# Altium schematic sheet Inverter.SchDoc
size 400 x 299 mm; SheetNumber: 1; SheetTotal: 2
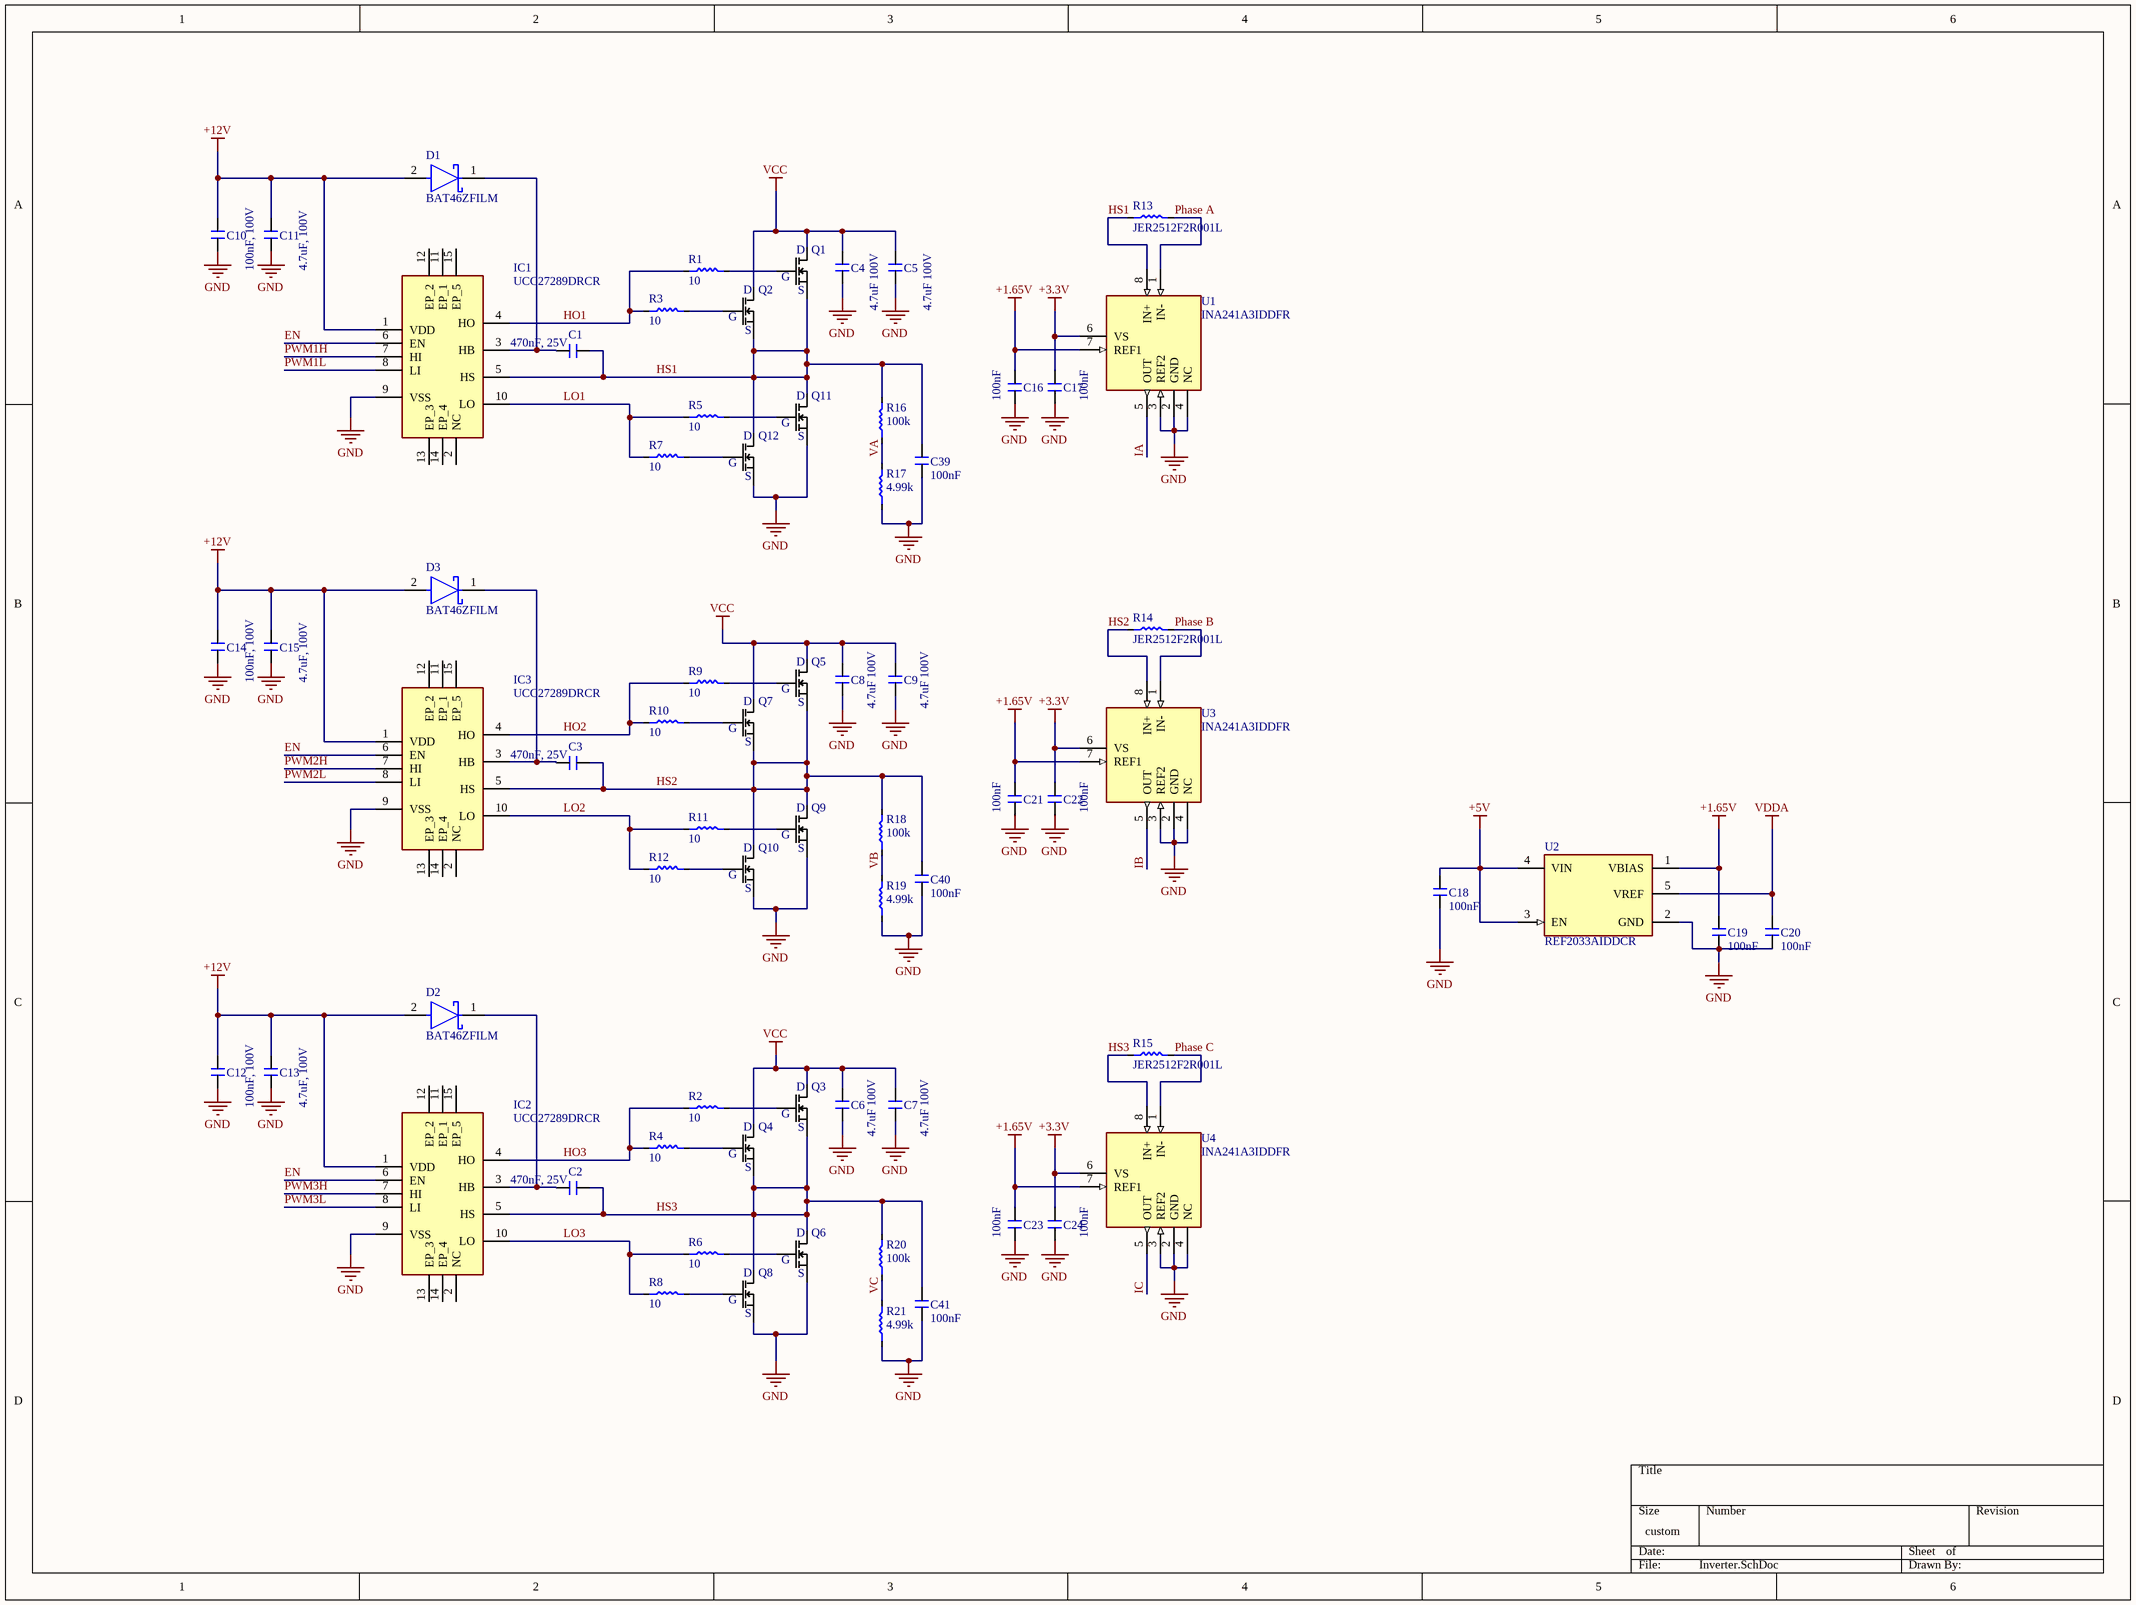
[diagram p0: Inverter.SchDoc]

## Parts
C1  470nF, 25V  [C_0805]
C2  470nF, 25V  [C_0805]
C3  470nF, 25V  [C_0805]
C4  4.7uF 100V  [C_1210]
C5  4.7uF 100V  [C_1210]
C6  4.7uF 100V  [C_1210]
C7  4.7uF 100V  [C_1210]
C8  4.7uF 100V  [C_1210]
C9  4.7uF 100V  [C_1210]
C10  100nF, 100V  [C_0805]
C11  4.7uF, 100V  [C_0805]
C12  100nF, 100V  [C_0805]
C13  4.7uF, 100V  [C_0805]
C14  100nF, 100V  [C_0805]
C15  4.7uF, 100V  [C_0805]
C16  100nF  [C_0603]
C17  100nF  [C_0603]
C18  100nF  [C_0603]
C19  100nF  [C_0603]
C20  100nF  [C_0603]
C21  100nF  [C_0603]
C22  100nF  [C_0603]
C23  100nF  [C_0603]
C24  100nF  [C_0603]
C39  100nF  [C_0603]
C40  100nF  [C_0603]
C41  100nF  [C_0603]
D1  BAT46ZFILM  [FP-SOD-123-MFG]
D2  BAT46ZFILM  [FP-SOD-123-MFG]
D3  BAT46ZFILM  [FP-SOD-123-MFG]
IC1  UCC27289DRCR  [TPS51200MDRCTEP]
IC2  UCC27289DRCR  [TPS51200MDRCTEP]
IC3  UCC27289DRCR  [TPS51200MDRCTEP]
Q1  BSZ075N08NS5ATMA1  [BSZ0909LSATMA1]  (value not drawn)
Q2  BSZ075N08NS5ATMA1  [BSZ0909LSATMA1]  (value not drawn)
Q3  BSZ075N08NS5ATMA1  [BSZ0909LSATMA1]  (value not drawn)
Q4  BSZ075N08NS5ATMA1  [BSZ0909LSATMA1]  (value not drawn)
Q5  BSZ075N08NS5ATMA1  [BSZ0909LSATMA1]  (value not drawn)
Q6  BSZ075N08NS5ATMA1  [BSZ0909LSATMA1]  (value not drawn)
Q7  BSZ075N08NS5ATMA1  [BSZ0909LSATMA1]  (value not drawn)
Q8  BSZ075N08NS5ATMA1  [BSZ0909LSATMA1]  (value not drawn)
Q9  BSZ075N08NS5ATMA1  [BSZ0909LSATMA1]  (value not drawn)
Q10  BSZ075N08NS5ATMA1  [BSZ0909LSATMA1]  (value not drawn)
Q11  BSZ075N08NS5ATMA1  [BSZ0909LSATMA1]  (value not drawn)
Q12  BSZ075N08NS5ATMA1  [BSZ0909LSATMA1]  (value not drawn)
R1  10  [R_0402]
R2  10  [R_0402]
R3  10  [R_0402]
R4  10  [R_0402]
R5  10  [R_0402]
R6  10  [R_0402]
R7  10  [R_0402]
R8  10  [R_0402]
R9  10  [R_0402]
R10  10  [R_0402]
R11  10  [R_0402]
R12  10  [R_0402]
R13  JER2512F2R001L  [JER2512F2R001L]
R14  JER2512F2R001L  [JER2512F2R001L]
R15  JER2512F2R001L  [JER2512F2R001L]
R16  100k  [R_0402]
R17  4.99k  [R_0402]
R18  100k  [R_0402]
R19  4.99k  [R_0402]
R20  100k  [R_0402]
R21  4.99k  [R_0402]
U1  INA241A3IDDFR  [SOT65P280X110-8N]
U2  REF2033AIDDCR  [FP-DDC0005A-MFG]
U3  INA241A3IDDFR  [SOT65P280X110-8N]
U4  INA241A3IDDFR  [SOT65P280X110-8N]

## Nets
+1.65V: C16.1 C19.1 C21.1 C23.1 U1.7(REF1) U2.1(VBIAS) U3.7(REF1) U4.7(REF1)
+3.3V: C17.1 C22.1 C24.1 U1.6(VS) U3.6(VS) U4.6(VS)
+5V: C18.1 U2.3(EN) U2.4(VIN)
+12V: C10.1 C11.1 C12.1 C13.1 C14.1 C15.1 D1.2(A) D2.2(A) D3.2(A) IC1.1(VDD) IC2.1(VDD) IC3.1(VDD)
GND: C4.2 C5.2 C6.2 C7.2 C8.2 C9.2 C10.2 C11.2 C12.2 C13.2 C14.2 C15.2 C16.2 C17.2 C18.2 C19.2 C20.2 C21.2 C22.2 C23.2 C24.2 C39.2 C40.2 C41.2 IC1.9(VSS) IC2.9(VSS) IC3.9(VSS) Q6.1,2,3,10(S_1) Q8.1,2,3,10(S_1) Q9.1,2,3,10(S_1) Q10.1,2,3,10(S_1) Q11.1,2,3,10(S_1) Q12.1,2,3,10(S_1) R17.2 R19.2 R21.2 U1.2(GND) U1.3(REF2) U1.4(NC) U2.2(GND) U3.2(GND) U3.3(REF2) U3.4(NC) U4.2(GND) U4.3(REF2) U4.4(NC)
VCC: C4.1 C5.1 C6.1 C7.1 C8.1 C9.1 Q1.5,6,7,8,9(D) Q2.5,6,7,8,9(D) Q3.5,6,7,8,9(D) Q4.5,6,7,8,9(D) Q5.5,6,7,8,9(D) Q7.5,6,7,8,9(D)
VDDA: C20.1 U2.5(VREF)
EN: IC1.6(EN) IC2.6(EN) IC3.6(EN)
HO1: IC1.4(HO) R1.2 R3.2
HO2: IC3.4(HO) R9.2 R10.2
HO3: IC2.4(HO) R2.2 R4.2
HS1: C1.1 C39.1 IC1.5(HS) Q1.1,2,3,10(S_1) Q2.1,2,3,10(S_1) Q11.5,6,7,8,9(D) Q12.5,6,7,8,9(D) R13.2 R16.1 U1.8(IN+)
HS2: C3.1 C40.1 IC3.5(HS) Q5.1,2,3,10(S_1) Q7.1,2,3,10(S_1) Q9.5,6,7,8,9(D) Q10.5,6,7,8,9(D) R14.2 R18.1 U3.8(IN+)
HS3: C2.1 C41.1 IC2.5(HS) Q3.1,2,3,10(S_1) Q4.1,2,3,10(S_1) Q6.5,6,7,8,9(D) Q8.5,6,7,8,9(D) R15.2 R20.1 U4.8(IN+)
IA: U1.5(OUT)
IB: U3.5(OUT)
IC: U4.5(OUT)
LO1: IC1.10(LO) R5.2 R7.2
LO2: IC3.10(LO) R11.2 R12.2
LO3: IC2.10(LO) R6.2 R8.2
Phase A: R13.1 U1.1(IN-)
Phase B: R14.1 U3.1(IN-)
Phase C: R15.1 U4.1(IN-)
PWM1H: IC1.7(HI)
PWM1L: IC1.8(LI)
PWM2H: IC3.7(HI)
PWM2L: IC3.8(LI)
PWM3H: IC2.7(HI)
PWM3L: IC2.8(LI)
VA: R16.2 R17.1
VB: R18.2 R19.1
VC: R20.2 R21.1
NetC1_2: C1.2 D1.1(C) IC1.3(HB)
NetC2_2: C2.2 D2.1(C) IC2.3(HB)
NetC3_2: C3.2 D3.1(C) IC3.3(HB)
NetQ1_4: Q1.4(G) R1.1
NetQ2_4: Q2.4(G) R3.1
NetQ3_4: Q3.4(G) R2.1
NetQ4_4: Q4.4(G) R4.1
NetQ5_4: Q5.4(G) R9.1
NetQ6_4: Q6.4(G) R6.1
NetQ7_4: Q7.4(G) R10.1
NetQ8_4: Q8.4(G) R8.1
NetQ9_4: Q9.4(G) R11.1
NetQ10_4: Q10.4(G) R12.1
NetQ11_4: Q11.4(G) R5.1
NetQ12_4: Q12.4(G) R7.1

Not connected (* = marked no-connect by the designer): IC1 2(NC) 11(EP_1) 12(EP_2) 13(EP_3) 14(EP_4) 15(EP_5); IC2 2(NC) 11(EP_1) 12(EP_2) 13(EP_3) 14(EP_4) 15(EP_5); IC3 2(NC) 11(EP_1) 12(EP_2) 13(EP_3) 14(EP_4) 15(EP_5)

## Notes on the sheet
- (in symbol BSZ075N08NS5ATMA1) S

## Library data of the parts
C1-C3 C10-C15 = C_0805: Manufacturer Part No: *; JLCPCB Part No: *
C4-C9 = C_1210
C16-C24 C39-C41 = C_0603
D1-D3 = CMP-12187-000006-1: DIODE SCHOTTKY 100V 150MA SOD123; Manufacturer: STMicroelectronics; Max Surge Forward Current: 1A; Capacitance: 10pF; Standoff Height: 0mm; Peak Reverse Current: 5uA; Value: 10pF; Max Junction Temp: +150°C; Automotive: No; Ipc Land Pattern Name: SOD375155X145-2; Device Class L2: Diodes; Device Class L1: Discrete Semiconductors; Temperature Range High: +150°C; ComponentLink2Description: Datasheet; Lead Free: Yes; Digikey Description: DIODE SCHOTTKY 100V 150MA SOD123; RoHS: TRUE; Category: Diode; Max Repetitive Reverse Voltage: 100V; ComponentLink2URL: https://www.st.com/resource/en/datasheet/bat46.pdf; Manufacturer Part Number: BAT46ZFILM; Temperature: to +150°C; Mouser Description: Schottky Diodes & Rectifiers schottky diode; Package: SOD-123; Forward Current: 150mA; Octopart: https://octopart.com/bat46zfilm-stmicroelectronics-658190; Height: 1.45mm; Device Class L3: Schottky Diodes
IC1-IC3 = UCC27289DRCR: Integrated Circuit; Manufacturer_Name: Texas Instruments; Datasheet Link: https://www.ti.com/lit/ds/symlink/ucc27289.pdf?ts=1715220331720&ref_url=https%253A%252F%252Fwww.mouser.tw%252F; Height: 1mm; Manufacturer_Part_Number: UCC27289DRCR; Mouser Part Number: 595-UCC27289DRCR; Mouser Price/Stock: https://www.mouser.co.uk/ProductDetail/Texas-Instruments/UCC27289DRCR?qs=rQFj71Wb1eUTx1xsT8GKBg%3D%3D
Q1-Q12 = BSZ075N08NS5ATMA1: MOSFET (N-Channel); Manufacturer_Name: Infineon; Datasheet Link: https://www.infineon.com/dgdl/Infineon-BSZ075N08NS5-DataSheet-v02_03-EN.pdf?fileId=5546d461454603990145ccd5743e61f8; Height: 1mm; Manufacturer_Part_Number: BSZ075N08NS5ATMA1; Mouser Part Number: 726-BSZ075N08NS5ATMA; Mouser Price/Stock: https://www.mouser.co.uk/ProductDetail/Infineon-Technologies/BSZ075N08NS5ATMA1?qs=3Bi3m9r5MQbCecwbz%252BCetA%3D%3D; Arrow Part Number: BSZ075N08NS5ATMA1; Arrow Price/Stock: https://www.arrow.com/en/products/bsz075n08ns5atma1/infineon-technologies-ag?utm_currency=USD&region=nac
R1-R12 R16-R21 = R_0402
R13-R15 = JER2512F2R001L: RES 1mΩ ±1% 2W 2512; Manufacturer Part No: JIERR JER2512F2R001L; LCSC Part No: C49164682
U1 U3 U4 = INA241A3IDDFR: -5-V to 110-V bidirectional ultraprecise current sense amplifier with enhanced PWM rejection; MF: Texas Instruments; Package: None; Price: None; Check_prices: https://www.snapeda.com/parts/INA241A3IDDFR/Texas+Instruments/view-part/?ref=eda; Value: *; SnapEDA_Link: https://www.snapeda.com/parts/INA241A3IDDFR/Texas+Instruments/view-part/?ref=snap; MP: INA241A3IDDFR; Availability: In Stock; Purchase-URL: https://pricing.snapeda.com/search?q=INA241A3IDDFR&ref=eda
U2 = CMP-04916-000008-1: IC VREF SERIES 1.65V/3.3V 5SOT; Manufacturer: Texas Instruments; Standoff Height: 0mm; Nominal Supply Current: 360uA; Min Supply Voltage: 3.32V; Output Type: Fixed; Number Of Outputs: 2; Output Voltage: 1.65/3.3V; Output Current: 20mA; Max Supply Voltage: 5.5V; Max Junction Temp: +150°C; Automotive: No; Height: 1.1mm; Package: DDC0005A; Reference Type: Series; Manufacturer Part Number: REF2033AIDDCR; Temperature Range High: +125°C; Lead Free: Yes; ComponentLink2Description: Datasheet; Device Class L1: Integrated Circuits (ICs); Category: IC; RoHS: TRUE; Device Class L3: Voltage References; ComponentLink2URL: http://www.ti.com/lit/ds/symlink/ref2033.pdf; Device Class L2: Power Management ICs; Octopart: https://octopart.com/ref2033aiddcr-texas+instruments-46921199; Digikey Description: IC VREF SERIES 1.65V/3.3V 5SOT; Temperature: -40°C to +125°C; Temperature Range Low: -40°C